# EAGLE design msx_usb2slot (EAGLE 7.6.0)

## Sheet 1 of 2
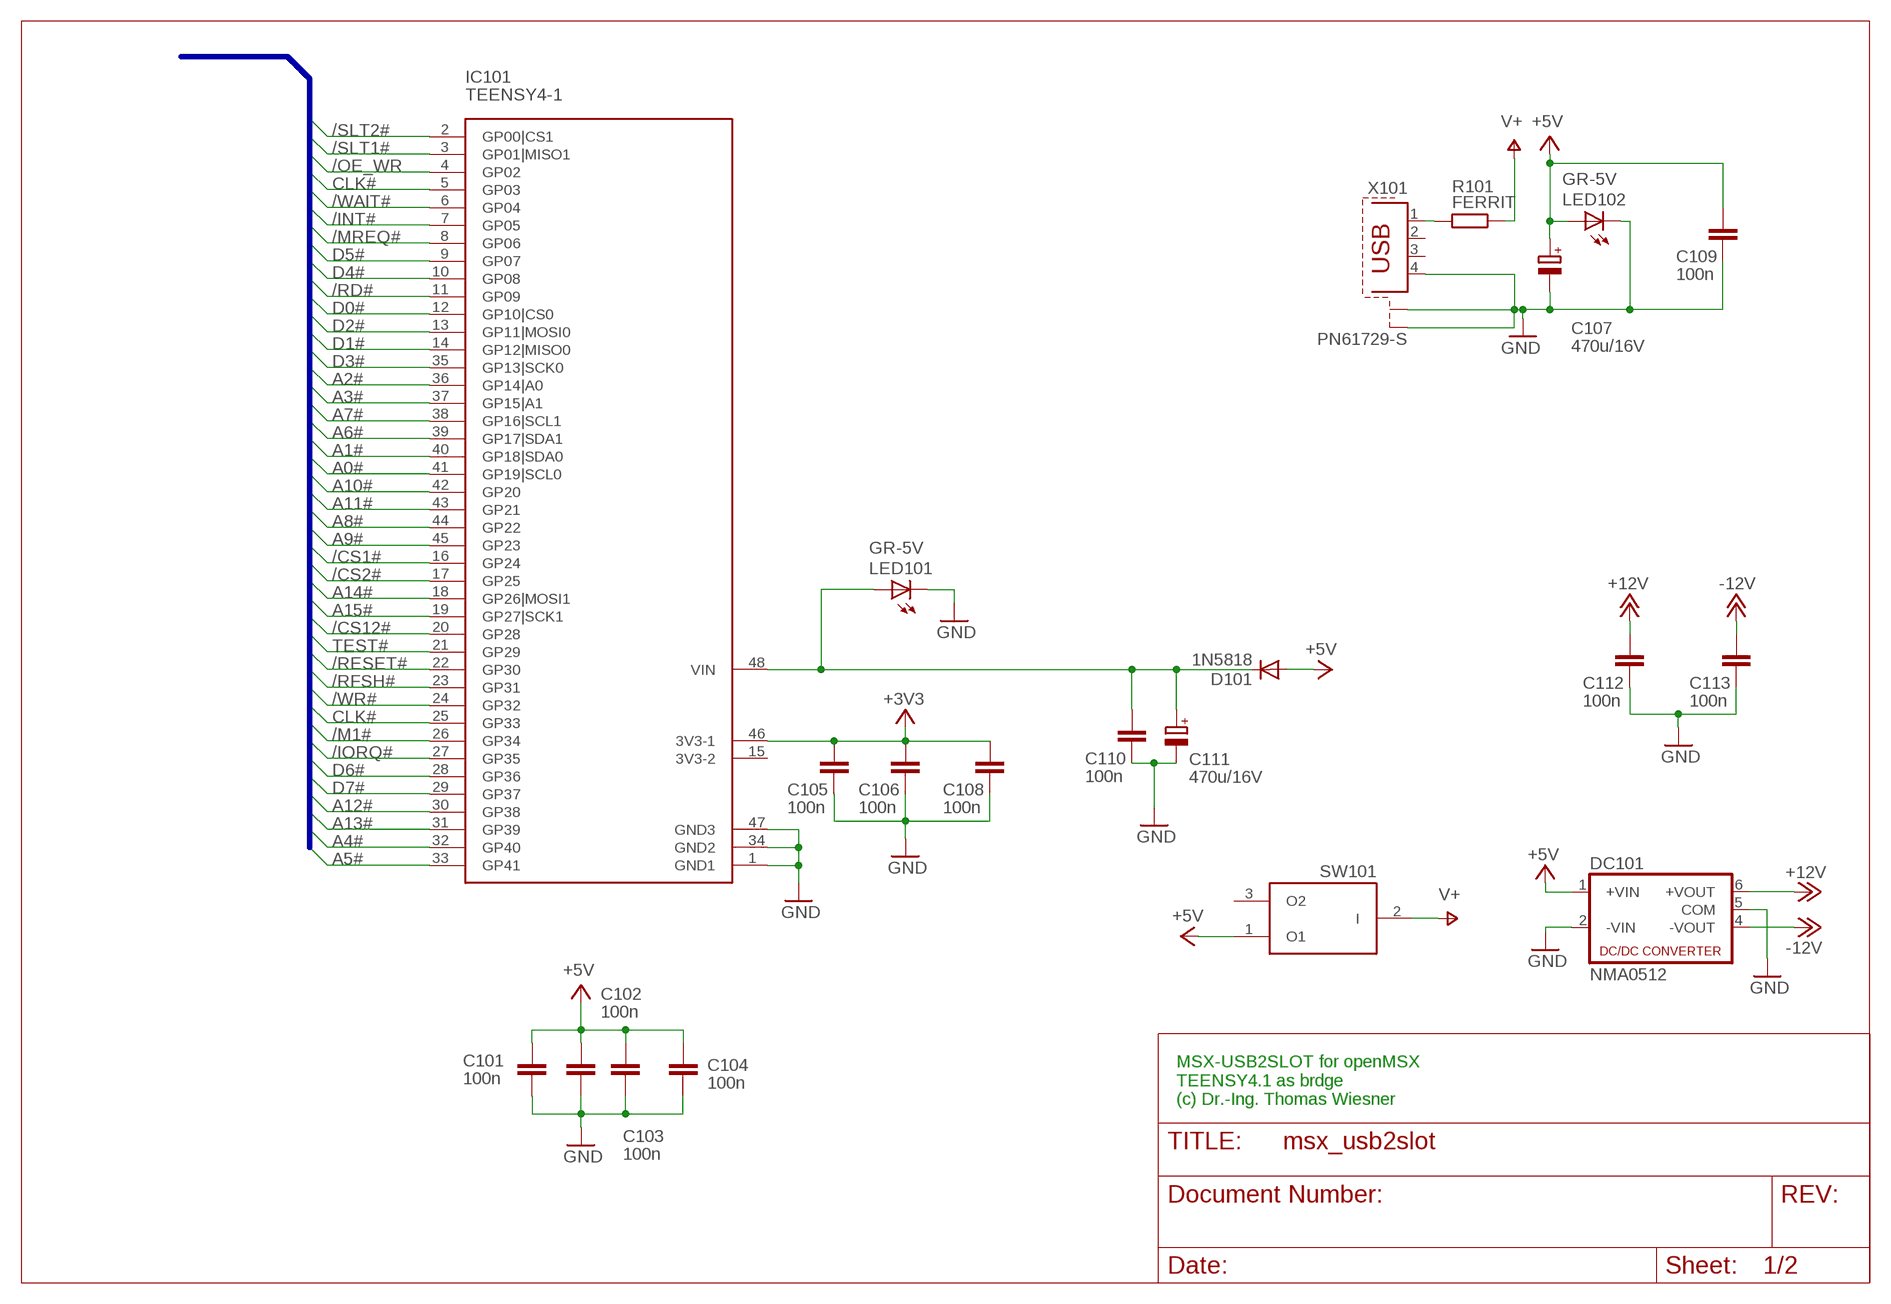
[diagram p0: schematic, sheet 1]

### Parts
C101  100n  C-EU025-025X050  [C025-025X050]
C102  100n  C-EU025-025X050  [C025-025X050]
C103  100n  C-EU025-025X050  [C025-025X050]
C104  100n  C-EU025-025X050  [C025-025X050]
C105  100n  C-EU025-025X050  [C025-025X050]
C106  100n  C-EU025-025X050  [C025-025X050]
C107  470u/16V  CPOL-EUE3.5-8  [E3,5-8]
C108  100n  C-EU025-025X050  [C025-025X050]
C109  100n  C-EU025-025X050  [C025-025X050]
C110  100n  C-EU025-025X050  [C025-025X050]
C111  470u/16V  CPOL-EUE3.5-8  [E3,5-8]
C112  100n  C-EU025-025X050  [C025-025X050]
C113  100n  C-EU025-025X050  [C025-025X050]
D101  1N5818  1N4004  [DO41-10]
DC101  NMA0512  NMA  [NMA]
IC101  TEENSY4-1  [TEENSY4-1]
LED101  GR-5V  LED3MM  [LED3MM]
LED102  GR-5V  LED3MM  [LED3MM]
R101  FERRIT  R-EU_0207/10  [0207/10]
SW101  TS-13PA  [TS-13-P]
X101  PN61729-S  [PN61729-S]

### Nets
+3V3: C105.2 C106.2 C108.2 IC101.46(3V3-1) ; also sheet 2
+5V: C101.2 C102.2 C103.2 C104.2 C107.+ C109.2 D101.A DC101.1(+VIN) LED102.A SW101.1(O1) ; also sheet 2
+12V: C112.2 DC101.6(+VOUT) ; also sheet 2
-12V: C113.2 DC101.4(-VOUT) ; also sheet 2
/CS1#: IC101.16(GP24) ; also sheet 2
/CS2#: IC101.17(GP25) ; also sheet 2
/CS12#: IC101.20(GP28) ; also sheet 2
/INT#: IC101.7(GP05) ; also sheet 2
/IORQ#: IC101.27(GP35) ; also sheet 2
/M1#: IC101.26(GP34) ; also sheet 2
/MREQ#: IC101.8(GP06) ; also sheet 2
/OE_WR: IC101.4(GP02) ; also sheet 2
/RD#: IC101.11(GP09) ; also sheet 2
/RESET#: IC101.22(GP30) ; also sheet 2
/RFSH#: IC101.23(GP31) ; also sheet 2
/SLT1#: IC101.3(GP01|MISO1) ; also sheet 2
/SLT2#: IC101.2(GP00|CS1) ; also sheet 2
/WAIT#: IC101.6(GP04) ; also sheet 2
/WR#: IC101.24(GP32) ; also sheet 2
A0#: IC101.41(GP19|SCL0) ; also sheet 2
A1#: IC101.40(GP18|SDA0) ; also sheet 2
A2#: IC101.36(GP14|A0) ; also sheet 2
A3#: IC101.37(GP15|A1) ; also sheet 2
A4#: IC101.32(GP40) ; also sheet 2
A5#: IC101.33(GP41) ; also sheet 2
A6#: IC101.39(GP17|SDA1) ; also sheet 2
A7#: IC101.38(GP16|SCL1) ; also sheet 2
A8#: IC101.44(GP22) ; also sheet 2
A9#: IC101.45(GP23) ; also sheet 2
A10#: IC101.42(GP20) ; also sheet 2
A11#: IC101.43(GP21) ; also sheet 2
A12#: IC101.30(GP38) ; also sheet 2
A13#: IC101.31(GP39) ; also sheet 2
A14#: IC101.18(GP26|MOSI1) ; also sheet 2
A15#: IC101.19(GP27|SCK1) ; also sheet 2
CLK#: IC101.5(GP03) IC101.25(GP33) ; also sheet 2
D0#: IC101.12(GP10|CS0) ; also sheet 2
D1#: IC101.14(GP12|MISO0) ; also sheet 2
D2#: IC101.13(GP11|MOSI0) ; also sheet 2
D3#: IC101.35(GP13|SCK0) ; also sheet 2
D4#: IC101.10(GP08) ; also sheet 2
D5#: IC101.9(GP07) ; also sheet 2
D6#: IC101.28(GP36) ; also sheet 2
D7#: IC101.29(GP37) ; also sheet 2
GND: C101.1 C102.1 C103.1 C104.1 C105.1 C106.1 C107.- C108.1 C109.1 C110.1 C111.- C112.1 C113.1 DC101.2(-VIN) DC101.5(COM) IC101.1(GND1) IC101.34(GND2) IC101.47(GND3) LED101.K(C) LED102.K(C) X101.4 X101.S1 X101.S2 ; also sheet 2
N$1: C110.2 C111.+ D101.C IC101.48(VIN) LED101.A
N$2: R101.2 X101.1
TEST#: IC101.21(GP29) ; also sheet 2
V+: R101.1 SW101.2(I)
Unconnected: IC101.15(3V3-2) SW101.3(O2) X101.2 X101.3

### Buses
B$1

### Notes on the sheet
- MSX-USB2SLOT for openMSX
  TEENSY4.1 as brdge
  (c) Dr.-Ing. Thomas Wiesner

## Sheet 2 of 2
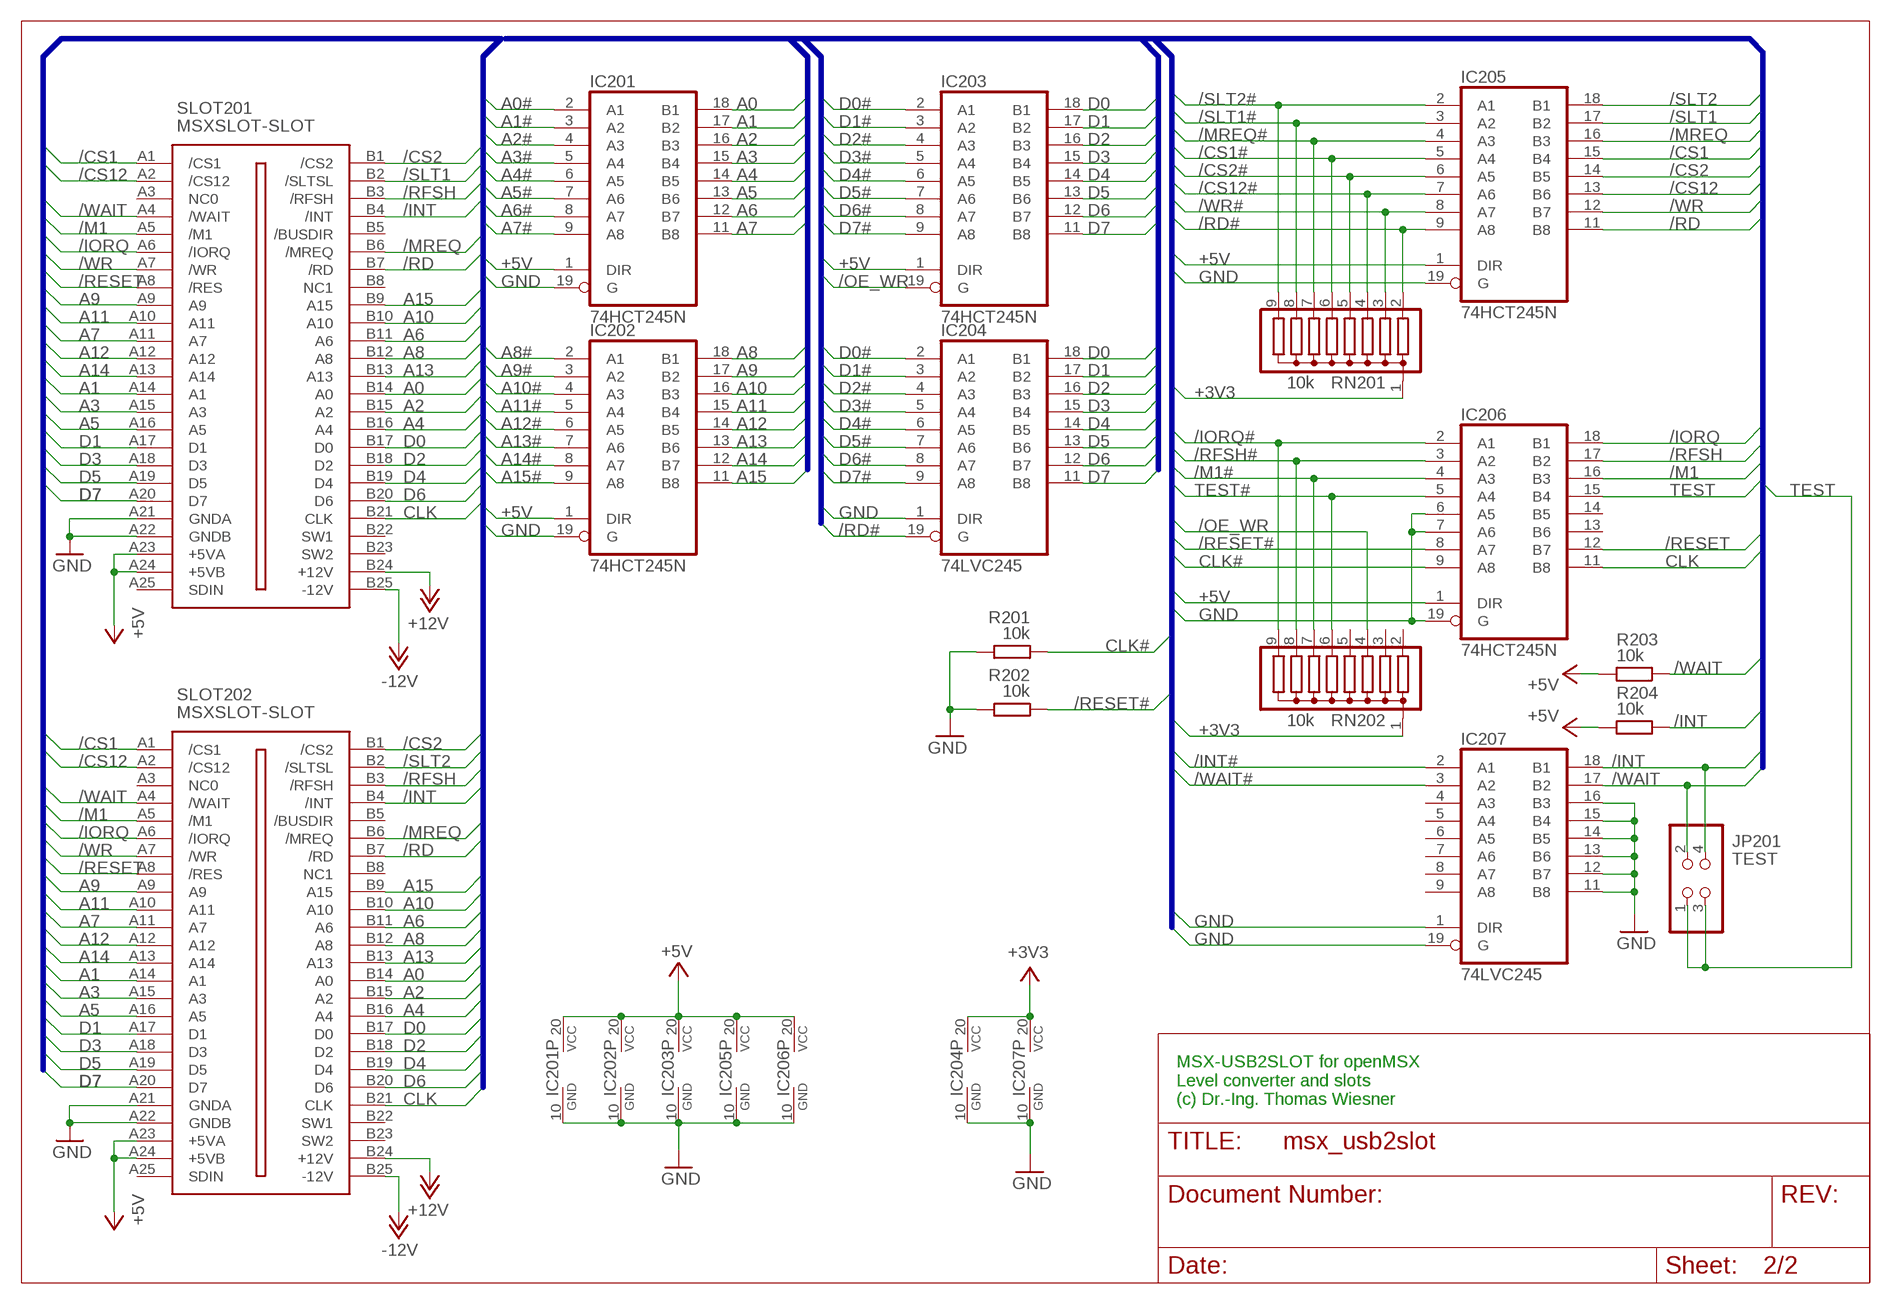
[diagram p1: schematic, sheet 2]

### Parts
IC201  74HCT245N  [DIL20]
IC202  74HCT245N  [DIL20]
IC203  74HCT245N  [DIL20]
IC204  74LVC245  74HCT245N  [DIL20]
IC205  74HCT245N  [DIL20]
IC206  74HCT245N  [DIL20]
IC207  74LVC245  74HCT245N  [DIL20]
JP201  TEST  PINHD-2X2  [2X02]
R201  10k  R-EU_0207/10  [0207/10]
R202  10k  R-EU_0207/10  [0207/10]
R203  10k  R-EU_0207/10  [0207/10]
R204  10k  R-EU_0207/10  [0207/10]
RN201  10k  G08R  [SIL9]
RN202  10k  G08R  [SIL9]
SLOT201  MSXSLOT-SLOT  [MSXSLOT]
SLOT202  MSXSLOT-SLOT  [MSXSLOT]

### Nets
+3V3: IC204.20(VCC) IC207.20(VCC) RN201.1 RN202.1 ; also sheet 1
+5V: IC201.1(DIR) IC201.20(VCC) IC202.1(DIR) IC202.20(VCC) IC203.1(DIR) IC203.20(VCC) IC205.1(DIR) IC205.20(VCC) IC206.1(DIR) IC206.20(VCC) R203.2 R204.2 SLOT201.A23(+5VA) SLOT201.A24(+5VB) SLOT202.A23(+5VA) SLOT202.A24(+5VB) ; also sheet 1
+12V: SLOT201.B24(+12V) SLOT202.B24(+12V) ; also sheet 1
-12V: SLOT201.B25(-12V) SLOT202.B25(-12V) ; also sheet 1
/CS1: IC205.15(B4) SLOT201.A1(/CS1) SLOT202.A1(/CS1)
/CS1#: IC205.5(A4) RN201.6 ; also sheet 1
/CS2: IC205.14(B5) SLOT201.B1(/CS2) SLOT202.B1(/CS2)
/CS2#: IC205.6(A5) RN201.5 ; also sheet 1
/CS12: IC205.13(B6) SLOT201.A2(/CS12) SLOT202.A2(/CS12)
/CS12#: IC205.7(A6) RN201.4 ; also sheet 1
/INT: IC207.18(B1) JP201.4 R204.1 SLOT201.B4(/INT) SLOT202.B4(/INT)
/INT#: IC207.2(A1) ; also sheet 1
/IORQ: IC206.18(B1) SLOT201.A6(/IORQ) SLOT202.A6(/IORQ)
/IORQ#: IC206.2(A1) RN202.9 ; also sheet 1
/M1: IC206.16(B3) SLOT201.A5(/M1) SLOT202.A5(/M1)
/M1#: IC206.4(A3) RN202.7 ; also sheet 1
/MREQ: IC205.16(B3) SLOT201.B6(/MREQ) SLOT202.B6(/MREQ)
/MREQ#: IC205.4(A3) RN201.7 ; also sheet 1
/OE_WR: IC203.19(G) RN202.4 ; also sheet 1
/RD: IC205.11(B8) SLOT201.B7(/RD) SLOT202.B7(/RD)
/RD#: IC204.19(G) IC205.9(A8) RN201.2 ; also sheet 1
/RESET: IC206.12(B7) SLOT201.A8(/RES) SLOT202.A8(/RES)
/RESET#: IC206.8(A7) R202.2 ; also sheet 1
/RFSH: IC206.17(B2) SLOT201.B3(/RFSH) SLOT202.B3(/RFSH)
/RFSH#: IC206.3(A2) RN202.8 ; also sheet 1
/SLT1: IC205.17(B2) SLOT201.B2(/SLTSL)
/SLT1#: IC205.3(A2) RN201.8 ; also sheet 1
/SLT2: IC205.18(B1) SLOT202.B2(/SLTSL)
/SLT2#: IC205.2(A1) RN201.9 ; also sheet 1
/WAIT: IC207.17(B2) JP201.2 R203.1 SLOT201.A4(/WAIT) SLOT202.A4(/WAIT)
/WAIT#: IC207.3(A2) ; also sheet 1
/WR: IC205.12(B7) SLOT201.A7(/WR) SLOT202.A7(/WR)
/WR#: IC205.8(A7) RN201.3 ; also sheet 1
A0: IC201.18(B1) SLOT201.B14(A0) SLOT202.B14(A0)
A0#: IC201.2(A1) ; also sheet 1
A1: IC201.17(B2) SLOT201.A14(A1) SLOT202.A14(A1)
A1#: IC201.3(A2) ; also sheet 1
A2: IC201.16(B3) SLOT201.B15(A2) SLOT202.B15(A2)
A2#: IC201.4(A3) ; also sheet 1
A3: IC201.15(B4) SLOT201.A15(A3) SLOT202.A15(A3)
A3#: IC201.5(A4) ; also sheet 1
A4: IC201.14(B5) SLOT201.B16(A4) SLOT202.B16(A4)
A4#: IC201.6(A5) ; also sheet 1
A5: IC201.13(B6) SLOT201.A16(A5) SLOT202.A16(A5)
A5#: IC201.7(A6) ; also sheet 1
A6: IC201.12(B7) SLOT201.B11(A6) SLOT202.B11(A6)
A6#: IC201.8(A7) ; also sheet 1
A7: IC201.11(B8) SLOT201.A11(A7) SLOT202.A11(A7)
A7#: IC201.9(A8) ; also sheet 1
A8: IC202.18(B1) SLOT201.B12(A8) SLOT202.B12(A8)
A8#: IC202.2(A1) ; also sheet 1
A9: IC202.17(B2) SLOT201.A9 SLOT202.A9
A9#: IC202.3(A2) ; also sheet 1
A10: IC202.16(B3) SLOT201.B10(A10) SLOT202.B10(A10)
A10#: IC202.4(A3) ; also sheet 1
A11: IC202.15(B4) SLOT201.A10(A11) SLOT202.A10(A11)
A11#: IC202.5(A4) ; also sheet 1
A12: IC202.14(B5) SLOT201.A12 SLOT202.A12
A12#: IC202.6(A5) ; also sheet 1
A13: IC202.13(B6) SLOT201.B13(A13) SLOT202.B13(A13)
A13#: IC202.7(A6) ; also sheet 1
A14: IC202.12(B7) SLOT201.A13(A14) SLOT202.A13(A14)
A14#: IC202.8(A7) ; also sheet 1
A15: IC202.11(B8) SLOT201.B9(A15) SLOT202.B9(A15)
A15#: IC202.9(A8) ; also sheet 1
CLK: IC206.11(B8) SLOT201.B21(CLK) SLOT202.B21(CLK)
CLK#: IC206.9(A8) R201.2 ; also sheet 1
D0: IC203.18(B1) IC204.18(B1) SLOT201.B17(D0) SLOT202.B17(D0)
D0#: IC203.2(A1) IC204.2(A1) ; also sheet 1
D1: IC203.17(B2) IC204.17(B2) SLOT201.A17(D1) SLOT202.A17(D1)
D1#: IC203.3(A2) IC204.3(A2) ; also sheet 1
D2: IC203.16(B3) IC204.16(B3) SLOT201.B18(D2) SLOT202.B18(D2)
D2#: IC203.4(A3) IC204.4(A3) ; also sheet 1
D3: IC203.15(B4) IC204.15(B4) SLOT201.A18(D3) SLOT202.A18(D3)
D3#: IC203.5(A4) IC204.5(A4) ; also sheet 1
D4: IC203.14(B5) IC204.14(B5) SLOT201.B19(D4) SLOT202.B19(D4)
D4#: IC203.6(A5) IC204.6(A5) ; also sheet 1
D5: IC203.13(B6) IC204.13(B6) SLOT201.A19(D5) SLOT202.A19(D5)
D5#: IC203.7(A6) IC204.7(A6) ; also sheet 1
D6: IC203.12(B7) IC204.12(B7) SLOT201.B20(D6) SLOT202.B20(D6)
D6#: IC203.8(A7) IC204.8(A7) ; also sheet 1
D7: IC203.11(B8) IC204.11(B8) SLOT201.A20(D7) SLOT202.A20(D7)
D7#: IC203.9(A8) IC204.9(A8) ; also sheet 1
GND: IC201.10(GND) IC201.19(G) IC202.10(GND) IC202.19(G) IC203.10(GND) IC204.1(DIR) IC204.10(GND) IC205.10(GND) IC205.19(G) IC206.6(A5) IC206.7(A6) IC206.10(GND) IC206.19(G) IC207.1(DIR) IC207.10(GND) IC207.11(B8) IC207.12(B7) IC207.13(B6) IC207.14(B5) IC207.15(B4) IC207.16(B3) IC207.19(G) R201.1 R202.1 SLOT201.A21(GNDA) SLOT201.A22(GNDB) SLOT202.A21(GNDA) SLOT202.A22(GNDB) ; also sheet 1
TEST: IC206.15(B4) JP201.1 JP201.3
TEST#: IC206.5(A4) RN202.6 ; also sheet 1
Unconnected: IC206.13(B6) IC206.14(B5) IC207.4(A3) IC207.5(A4) IC207.6(A5) IC207.7(A6) IC207.8(A7) IC207.9(A8) RN202.2 RN202.3 RN202.5 SLOT201.A3(NC0) SLOT201.A25(SDIN) SLOT201.B5(/BUSDIR) SLOT201.B8(NC1) SLOT201.B22(SW1) SLOT201.B23(SW2) SLOT202.A3(NC0) SLOT202.A25(SDIN) SLOT202.B5(/BUSDIR) SLOT202.B8(NC1) SLOT202.B22(SW1) SLOT202.B23(SW2)

### Buses
B$5
B$2

### Notes on the sheet
- MSX-USB2SLOT for openMSX
  Level converter and slots
  (c) Dr.-Ing. Thomas Wiesner

## Library data of the parts
C101-C106 C108-C110 C112 C113 = rcl:C-EU: CAPACITOR, European symbol
C107 C111 = rcl:CPOL-EU: POLARIZED CAPACITOR, European symbol
D101 = diode:1N4004: DIODE general purpose rectifier, 1 A
DC101 = dc-dc-converter:NMA: DC-DC CONVERTER; MF: C & D TECHNOLOGIES, INC; MPN: NMA0515SC; OC_FARNELL: 1021434; OC_NEWARK: 61K3064
IC101 = mbc:TEENSY4-1
IC201-IC207 = 74xx-eu:74*245: Octal BUS TRANSCEIVER, 3-state
JP201 = pinhead:PINHD-2X2: PIN HEADER
LED101 LED102 = led:LED: LED OSRAM: - CHIPLED LG R971, LG N971, LY N971, LG Q971, LY Q971, LO R971, LY R971 LH N974, LH R974 LS Q976, LO Q976, LY Q976 LO Q996 - Hyper CHIPLED LW Q18S LB Q993, LB Q99A, LB R99A - SideLED LS A670, LO A670, LY A670, LG A670, LP A670 LB A673, LV A673, LT A673, LW A673 LH A674 LY A675 LS A676, LA A676, LO A676, LY A676, LW A676 LS A679, LY A679, LG A679 - Hyper Micro SIDELED® LS Y876, LA Y876, LO Y876, LY Y876 LT Y87S - SmartLED LW L88C, LW L88S LB L89C, LB L89S, LG L890 LS L89K, LO L89K, LY L89K LS L896, LA L896, LO L896, LY L896 - TOPLED LS T670, LO T670, LY T670, LG T670, LP T670 LSG T670, LSP T670, LSY T670, LOP T670, LYG T670 LG T671, LOG T671, LSG T671 LB T673, LV T673, LT T673, LW T673 LH T674 LS T676, LA T676, LO T676, LY T676, LB T676, LH T676, LSB T676, LW T676 LB T67C, LV T67C, LT T67C, LS T67K, LO T67K, LY T67K, LW E67C LS E67B, LA E67B, LO E67B, LY E67B, LB E67C, LV E67C, LT E67C LW T67C LS T679, LY T679, LG T679 LS T770, LO T770, LY T770, LG T770, LP T770 LB T773, LV T773, LT T773, LW T773 LH T774 LS E675, LA E675, LY E675, LS T675 LS T776, LA T776, LO T776, LY T776, LB T776 LHGB T686 LT T68C, LB T68C - Hyper Mini TOPLED® LB M676 - Mini TOPLED Santana® LG M470 LS M47K, LO M47K, LY M47K Source: http://www.osram.convergy.de LUXEON: - LUMILED® LXK2-PW12-R00, LXK2-PW12-S00, LXK2-PW14-U00, LXK2-PW14-V00 LXK2-PM12-R00, LXK2-PM12-S00, LXK2-PM14-U00 LXK2-PE12-Q00, LXK2-PE12-R00, LXK2-PE12-S00, LXK2-PE14-T00, LXK2-PE14-U00 LXK2-PB12-K00, LXK2-PB12-L00, LXK2-PB12-M00, LXK2-PB14-N00, LXK2-PB14-P00, LXK2-PB14-Q00 LXK2-PR12-L00, LXK2-PR12-M00, LXK2-PR14-Q00, LXK2-PR14-R00 LXK2-PD12-Q00, LXK2-PD12-R00, LXK2-PD12-S00 LXK2-PH12-R00, LXK2-PH12-S00 LXK2-PL12-P00, LXK2-PL12-Q00, LXK2-PL12-R00 Source: www.luxeon.com KINGBRIGHT: KA-3528ASYC Source: www.kingbright.com
R101 R201-R204 = resistor:R-EU_: RESISTOR, European symbol
RN201 RN202 = resistor-sil:G08R: SIL RESISTOR; OC_FARNELL: unknown; OC_NEWARK: unknown
SLOT201 SLOT202 = mbc:MSXSLOT: MSX-Slot-Verbinder
SW101 = mbc:TS-13P: TS-13P - Umschalter liegend Printmontage
X101 = con-berg:PN61729-S: BERG USB connector; OC_FARNELL: unknown; OC_NEWARK: unknown

## Board
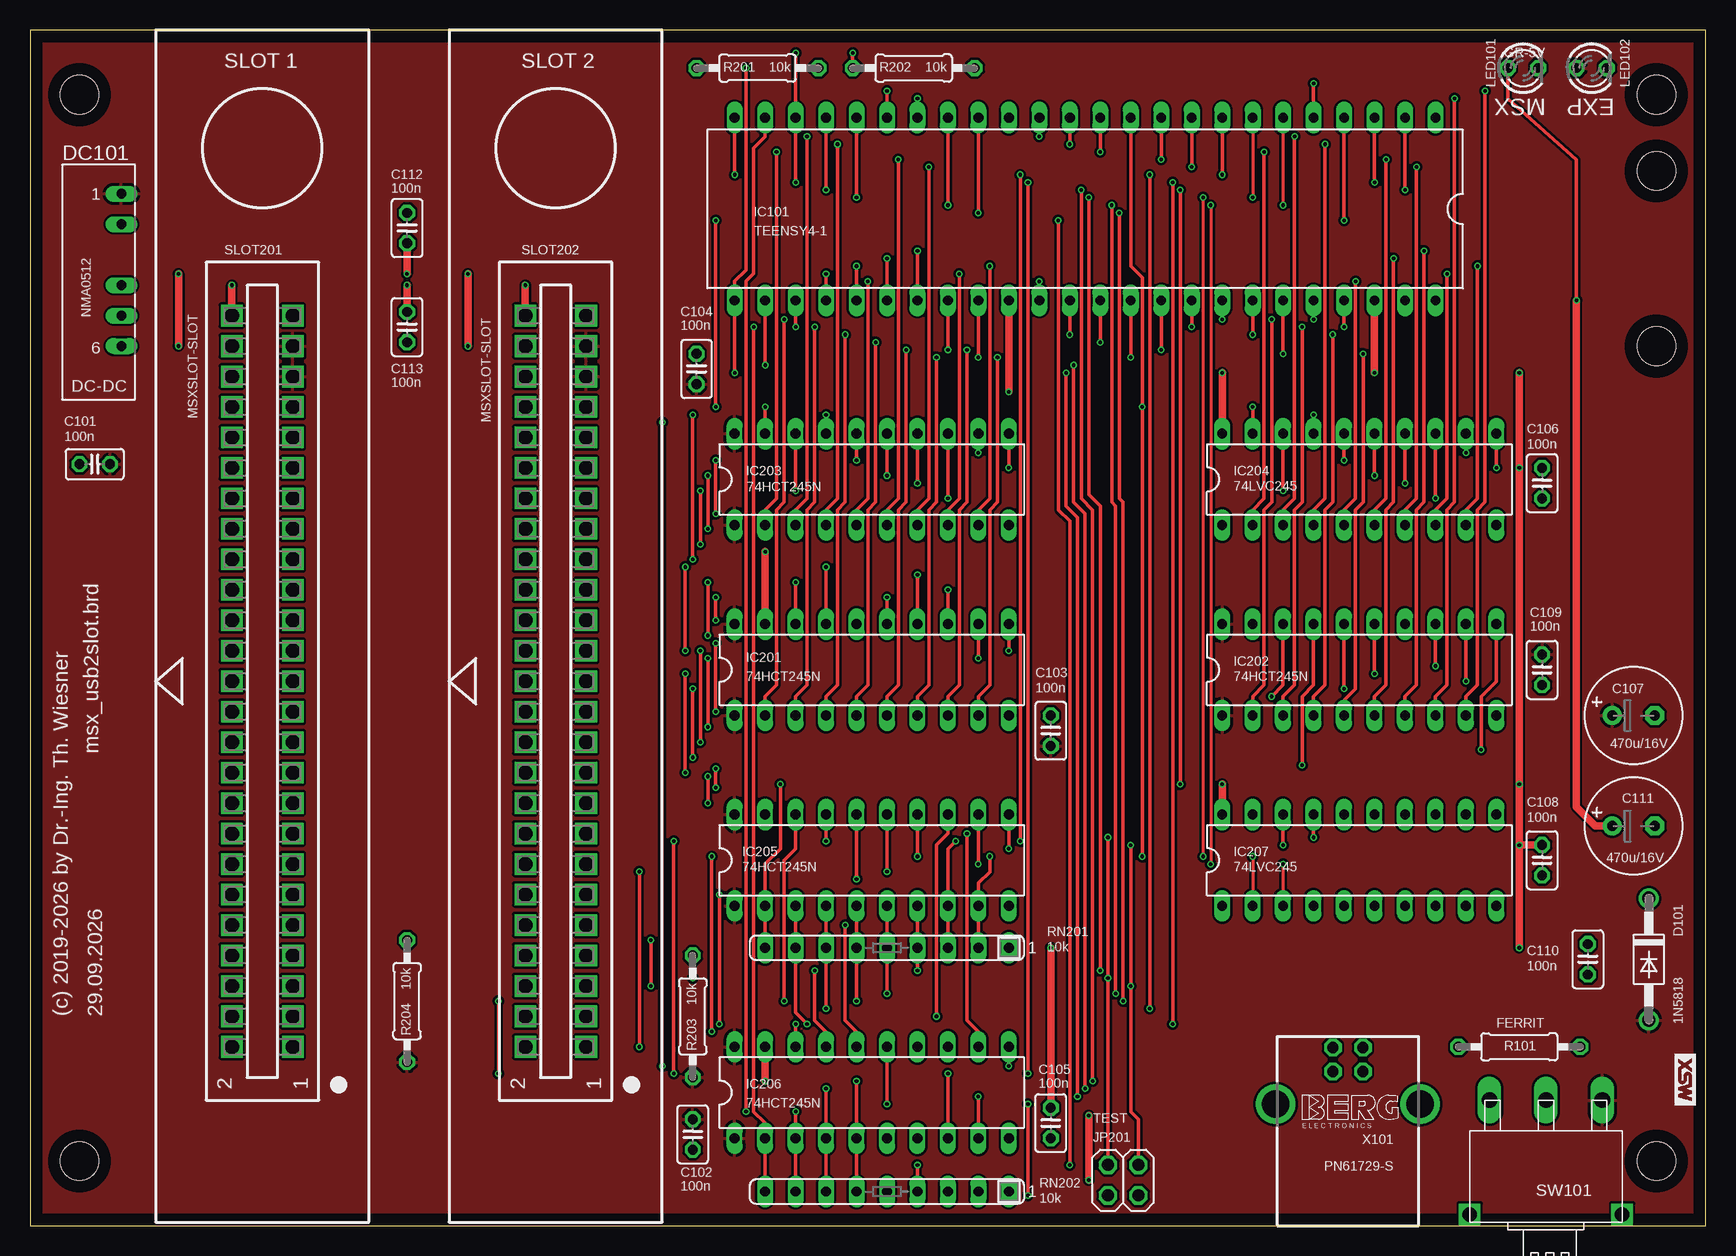
[diagram p2: board, top side]
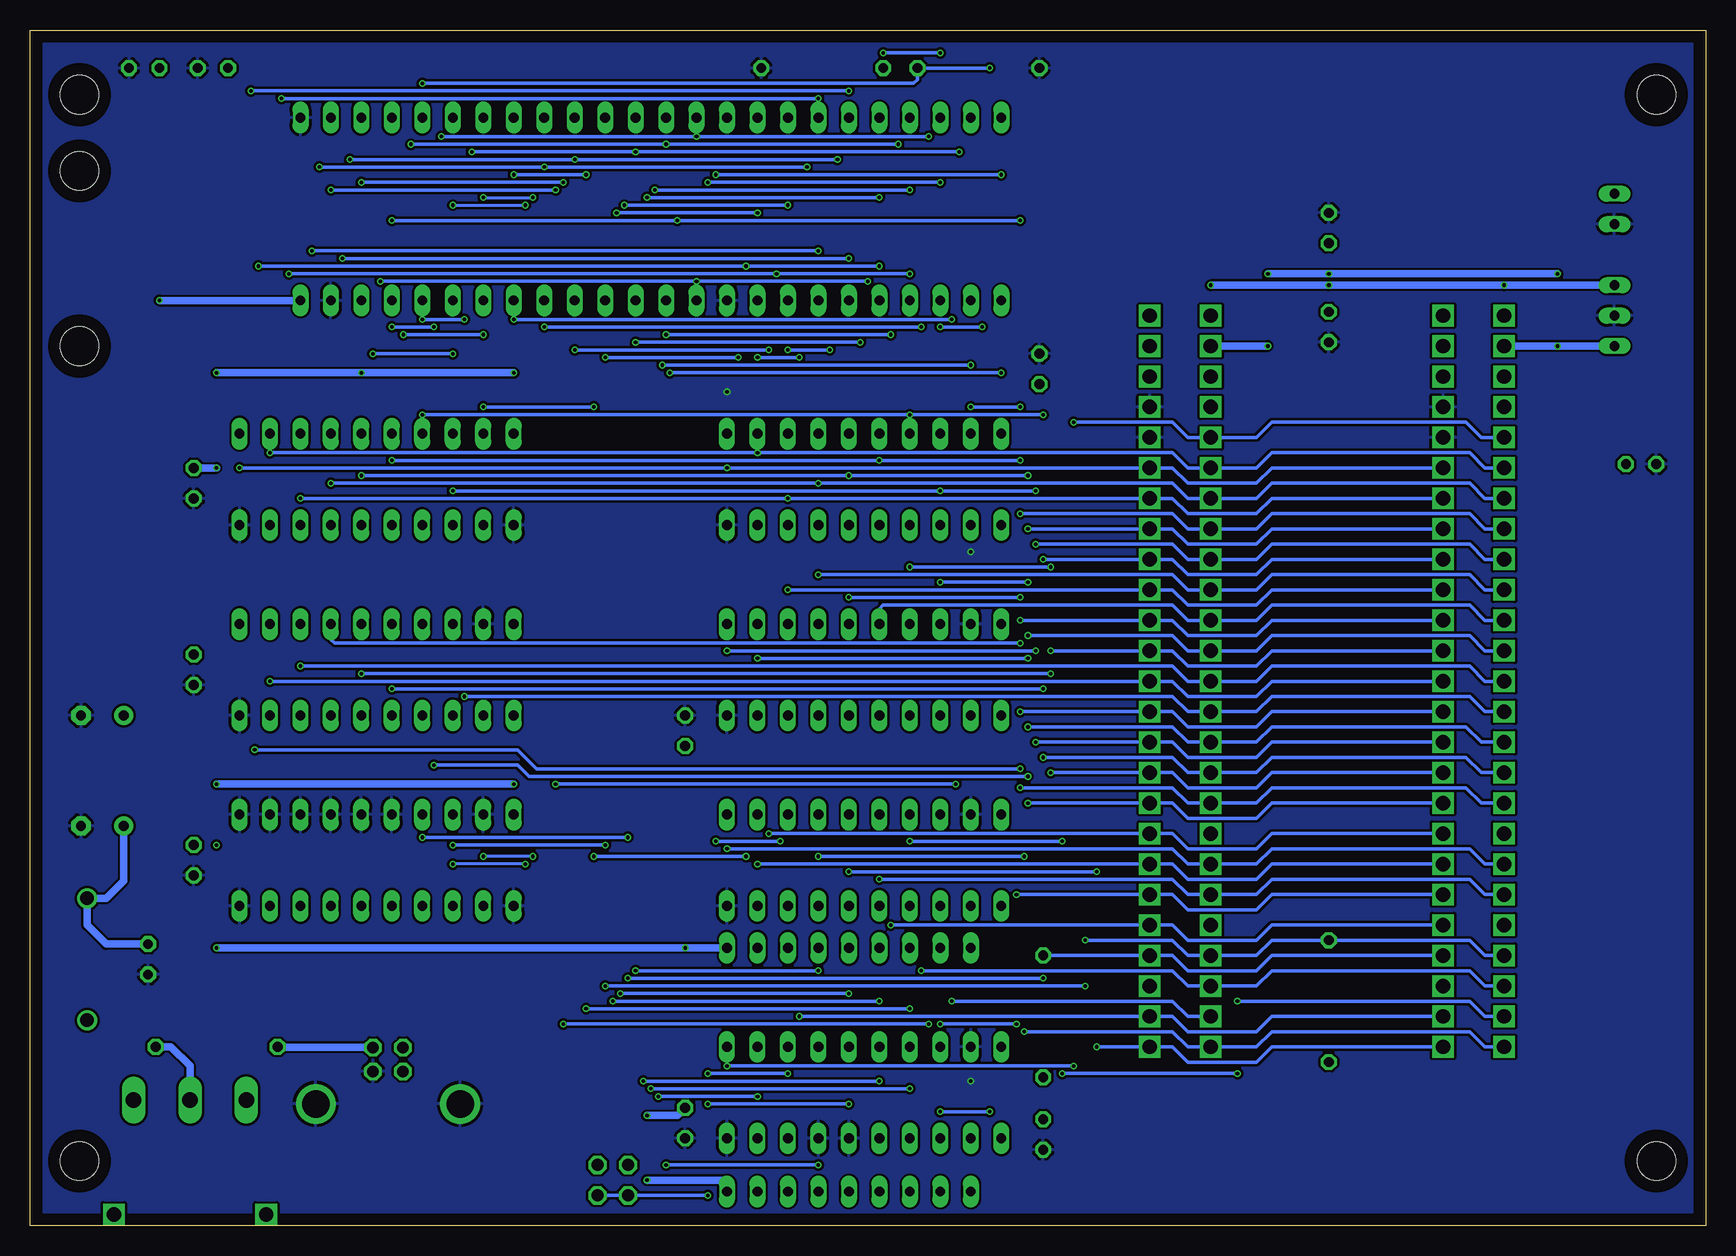
[diagram p3: board, bottom side, seen from below]

Size 139.7 x 99.69 mm. Coordinates in mm from the lower left corner, seen from the top.
Outline: 0,0 139.7,0 139.7,99.69 0,99.69 0,0
Copper layers (1*16): Top 0.035mm / dielectric 1.5mm / Bottom 0.035mm
Design rules "default *": minimum track width 10mil, minimum drill 0.3mm, track to track 8mil, track to pad 4mil, pad to pad 8mil, via to via 8mil, smd to smd 8mil, copper to edge 40mil, drill to drill 8mil, minimum pad ring 10mil, minimum via ring 0.125mm, stop-mask expansion 4mil, vias tented up to drill 0mil, thermal gap 10mil
Holes 3.2 mm at 135.57,5.4 135.57,94.3 4.13,94.3 4.13,5.4 135.57,87.95 135.57,73.34

### Footprints (pad centres in the part's own frame; a part is rotated, then mirrored left to right if it is on the bottom)
C025-025X050 = drill 0.813 octagon: 1 -1.27,0; 2 1.27,0
E3,5-8 = drill 0.813 pad 1.6: + -1.778,0 | drill 0.813 pad 1.6 octagon: - 1.778,0
DO41-10 = drill 1.118: A 5.08,0; C -5.08,0
NMA = drill 0.813 long: 1 0,6.35; 2 0,3.81; 4 0,-1.27; 5 0,-3.81; 6 0,-6.35
TEENSY4-1 = drill 0.813 long: 1 -29.21,-7.62; 2 -26.67,-7.62; 3 -24.13,-7.62; 4 -21.59,-7.62; 5 -19.05,-7.62; 6 -16.51,-7.62; 7 -13.97,-7.62; 8 -11.43,-7.62; 9 -8.89,-7.62; 10 -6.35,-7.62; 11 -3.81,-7.62; 12 -1.27,-7.62; 13 1.27,-7.62; 14 3.81,-7.62; 15 6.35,-7.62; 16 8.89,-7.62; 17 11.43,-7.62; 18 13.97,-7.62; 19 16.51,-7.62; 20 19.05,-7.62; 21 21.59,-7.62; 22 24.13,-7.62; 23 26.67,-7.62; 24 29.21,-7.62; 25 29.21,7.62; 26 26.67,7.62; 27 24.13,7.62; 28 21.59,7.62; 29 19.05,7.62; 30 16.51,7.62; 31 13.97,7.62; 32 11.43,7.62; 33 8.89,7.62; 34 6.35,7.62; 35 3.81,7.62; 36 1.27,7.62; 37 -1.27,7.62; 38 -3.81,7.62; 39 -6.35,7.62; 40 -8.89,7.62; 41 -11.43,7.62; 42 -13.97,7.62; 43 -16.51,7.62; 44 -19.05,7.62; 45 -21.59,7.62; 46 -24.13,7.62; 47 -26.67,7.62; 48 -29.21,7.62
DIL20 = drill 0.813 long: 1 -11.43,-3.81; 2 -8.89,-3.81; 3 -6.35,-3.81; 4 -3.81,-3.81; 5 -1.27,-3.81; 6 1.27,-3.81; 7 3.81,-3.81; 8 6.35,-3.81; 9 8.89,-3.81; 10 11.43,-3.81; 11 11.43,3.81; 12 8.89,3.81; 13 6.35,3.81; 14 3.81,3.81; 15 1.27,3.81; 16 -1.27,3.81; 17 -3.81,3.81; 18 -6.35,3.81; 19 -8.89,3.81; 20 -11.43,3.81
2X02 = drill 1.016 octagon: 1 -1.27,-1.27; 2 -1.27,1.27; 3 1.27,-1.27; 4 1.27,1.27
LED3MM = drill 0.813 octagon: A -1.27,0; K 1.27,0
0207/10 = drill 0.813 octagon: 1 -5.08,0; 2 5.08,0
SIL9 = drill 0.813 long: 1 -10.16,0; 2 -7.62,0; 3 -5.08,0; 4 -2.54,0; 5 0,0; 6 2.54,0; 7 5.08,0; 8 7.62,0; 9 10.16,0
MSXSLOT = drill 1.2 pad 1.778 square: A1 30.48,2.54; A2 27.94,2.54; A3 25.4,2.54; A4 22.86,2.54; A5 20.32,2.54; A6 17.78,2.54; A7 15.24,2.54; A8 12.7,2.54; A9 10.16,2.54; A10 7.62,2.54; A11 5.08,2.54; A12 2.54,2.54; A13 0,2.54; A14 -2.54,2.54; A15 -5.08,2.54; A16 -7.62,2.54; A17 -10.16,2.54; A18 -12.7,2.54; A19 -15.24,2.54; A20 -17.78,2.54; A21 -20.32,2.54; A22 -22.86,2.54; A23 -25.4,2.54; A24 -27.94,2.54; A25 -30.48,2.54; B1 30.48,-2.54; B2 27.94,-2.54; B3 25.4,-2.54; B4 22.86,-2.54; B5 20.32,-2.54; B6 17.78,-2.54; B7 15.24,-2.54; B8 12.7,-2.54; B9 10.16,-2.54; B10 7.62,-2.54; B11 5.08,-2.54; B12 2.54,-2.54; B13 0,-2.54; B14 -2.54,-2.54; B15 -5.08,-2.54; B16 -7.62,-2.54; B17 -10.16,-2.54; B18 -12.7,-2.54; B19 -15.24,-2.54; B20 -17.78,-2.54; B21 -20.32,-2.54; B22 -22.86,-2.54; B23 -25.4,-2.54; B24 -27.94,-2.54; B25 -30.48,-2.54
TS-13-P = drill 1.3 long: 1 0,-4.7; 2 0,0; 3 0,4.7 | drill 1.2 square: P$1 -9.525,-6.35; P$2 -9.525,6.35
PN61729-S = drill 0.95 octagon: 1 1.25,4.71; 2 -1.25,4.71; 3 -1.25,2.71; 4 1.25,2.71 | drill 2.3 pad 2.9: S1 -6.02,0; S2 6.02,0

### Placement (x,y rotation side)
C101  5.4,63.5 0 top
C102  55.24,7.62 90 top
C103  85.09,41.27 270 top
C104  55.56,71.44 270 top
C105  85.09,8.57 90 top
C106  126.05,61.91 90 top
C107  133.67,42.55 0 top
C108  126.05,30.48 90 top
C109  126.05,46.35 90 top
C110  129.86,22.23 90 top
C111  133.67,33.34 0 top
C112  31.43,83.19 270 top
C113  31.43,74.93 90 top
D101  134.94,22.23 270 top
DC101  7.62,79.69 0 top
IC101  87.95,84.77 180 top
IC201  70.17,46.35 0 top
IC202  110.81,46.35 0 top
IC203  70.17,62.23 0 top
IC204  110.81,62.23 0 top
IC205  70.17,30.48 0 top
IC206  70.17,11.11 0 top
IC207  110.81,30.48 0 top
JP201  91.12,3.81 0 top
LED101  124.46,96.52 0 top
LED102  130.18,96.52 0 top
R101  124.14,14.92 180 top
R201  60.64,96.52 0 top
R202  73.66,96.52 180 top
R203  55.24,17.46 270 top
R204  31.43,18.73 270 top
RN201  71.44,23.18 180 top
RN202  71.44,2.86 180 top
SLOT201  19.37,45.4 270 top
SLOT202  43.81,45.4 270 top
SW101  126.36,10.48 90 top
X101  109.86,10.16 0 top

### Tracks (layer width: path | path; a pad name or v marks a point on that pad's centre or on a via)
+3V3  (via drill 0.3)
  Top 0.61: v85.09,23.18 C105.2 | v88.27,3.81 v88.27,9.21 | v124.14,23.18 v124.14,31.75 | v124.14,31.75 v124.14,36.83 v124.14,63.18 v124.14,71.12 | v99.38,36.83 IC207.20 | v99.38,71.12 IC204.20 | IC101.46 v112.08,71.12 | C108.2 v124.14,31.75
  Bottom 0.61: RN201.1 v85.09,23.18 v124.14,23.18 | RN202.1 81.6,3.49 81.92,3.81 v88.27,3.81 | v88.27,9.21 85.72,9.21 C105.2 | v124.14,36.83 v99.38,36.83 | v124.14,71.12 v112.08,71.12 v99.38,71.12 | C106.2 v124.14,63.18
+5V
  pour Top: 0,99.69 139.7,99.69 139.7,0 0,0
+12V  (via drill 0.3)
  Top 0.61: v36.51,73.34 v36.51,79.38 | v12.38,79.38 v12.38,73.34 | C112.2 v31.43,79.38
  Bottom 0.61: DC101.6 v12.38,73.34 SLOT201.B24 | SLOT202.B24 v36.51,73.34 | v36.51,79.38 v31.43,79.38 v12.38,79.38
-12V  (via drill 0.3)
  Top 0.61: v41.27,78.42 SLOT202.B25 | SLOT201.B25 v16.83,78.42 | C113.2 v31.43,78.42
  Bottom 0.61: DC101.4 v16.83,78.42 v31.43,78.42 v41.27,78.42
/CS1  (via drill 0.3)
  Top 0.305: v50.8,14.92 v50.8,29.53 | v71.44,29.53 IC205.15
  Bottom 0.305: SLOT201.A1 36.2,14.92 37.47,13.65 43.18,13.65 44.45,14.92 SLOT202.A1 v50.8,14.92 | v50.8,29.53 v71.44,29.53
/CS1#  (via drill 0.3)
  Top 0.305: IC205.5 RN201.6 v68.9,18.73 | IC101.16 v79.06,84.45 | v90.81,84.45 90.81,60.64 91.12,60.33 v91.12,18.73
  Bottom 0.305: v79.06,84.45 v90.81,84.45 | v91.12,18.73 v68.9,18.73
/CS2  (via drill 0.3)
  Top 0.305: v56.83,16.19 v56.83,30.8 | v73.98,30.8 IC205.14
  Bottom 0.305: SLOT201.B1 18.41,14.92 19.68,16.19 36.2,16.19 37.47,14.92 SLOT202.B1 43.18,14.92 44.45,16.19 v56.83,16.19 | v56.83,30.8 v73.98,30.8
/CS2#  (via drill 0.3)
  Top 0.305: IC205.6 RN201.5 v71.44,19.37 | IC101.17 v76.52,85.09 | v90.17,85.09 90.17,60.33 90.49,60.01 v90.49,19.37
  Bottom 0.305: v76.52,85.09 v90.17,85.09 | v90.49,19.37 v71.44,19.37
/CS12  (via drill 0.3)
  Top 0.305: v75.56,17.46 75.56,31.75 76.52,32.7 IC205.13
  Bottom 0.305: SLOT201.A2 36.2,17.46 37.47,16.19 43.18,16.19 44.45,17.46 SLOT202.A2 v75.56,17.46
/CS12#  (via drill 0.3)
  Top 0.305: RN201.4 IC205.7 v73.98,21.27 | IC101.20 v68.9,85.72 | v88.27,85.72 88.27,60.96 89.22,60.01 v89.22,21.27
  Bottom 0.305: v68.9,85.72 v88.27,85.72 | v89.22,21.27 v73.98,21.27
/INT  (via drill 0.3)
  Top 0.305: v91.76,31.75 v91.76,20 91.76,9.53 92.39,8.89 JP201.4 | v104.46,31.75 IC207.18 | v51.75,20 v51.75,23.81
  Bottom 0.305: SLOT201.B4 18.41,22.54 19.68,23.81 R204.1 36.2,23.81 37.47,22.54 SLOT202.B4 43.18,22.54 44.45,23.81 v51.75,23.81 | v91.76,31.75 v104.46,31.75 | v91.76,20 v51.75,20
/INT#  (via drill 0.3)
  Top 0.254: IC101.7 v101.92,85.72 | v97.79,85.72 v97.79,30.8 | v101.92,30.8 IC207.2
  Bottom 0.254: v101.92,85.72 v97.79,85.72 | v97.79,30.8 v101.92,30.8
/IORQ  (via drill 0.3)
  Top 0.305: v57.47,27.62 v57.47,16.83 | v63.82,16.83 IC206.18
  Bottom 0.305: SLOT201.A6 36.2,27.62 37.47,26.35 43.18,26.35 44.45,27.62 SLOT202.A6 v57.47,27.62 | v57.47,16.83 v63.82,16.83
/IORQ#  (via drill 0.3)
  Top 0.305: RN202.9 IC206.2 61.28,8.57 60.33,9.53 v60.33,74.93 | v63.82,74.93 IC101.27
  Bottom 0.305: v60.33,74.93 v63.82,74.93
/M1  (via drill 0.3)
  Top 0.305: v67.94,25.08 67.94,17.14 68.9,16.19 IC206.16
  Bottom 0.305: SLOT201.A5 36.2,25.08 37.47,23.81 43.18,23.81 44.45,25.08 SLOT202.A5 v67.94,25.08
/M1#  (via drill 0.3)
  Top 0.305: RN202.7 IC206.4 v66.36,11.43 | IC101.26 v61.28,71.75 | v87,71.75 87,60.33 87.95,59.37 v87.95,11.43
  Bottom 0.305: v61.28,71.75 v87,71.75 | v87.95,11.43 v66.36,11.43
/MREQ  (via drill 0.3)
  Top 0.305: v68.9,28.89 IC205.16
  Bottom 0.305: SLOT201.B6 18.41,27.62 19.68,28.89 36.2,28.89 37.47,27.62 SLOT202.B6 43.18,27.62 44.45,28.89 v68.9,28.89
/MREQ#  (via drill 0.3)
  Top 0.305: IC205.4 RN201.7 v66.36,18.1 | IC101.8 v99.38,87.63 | v93.34,87.63 v93.34,18.1
  Bottom 0.305: v99.38,87.63 v93.34,87.63 | v93.34,18.1 v66.36,18.1
/OE_WR  (via drill 0.3)
  Top 0.305: IC101.4 v109.54,83.82 | v57.15,83.82 v57.15,68.26 | v61.28,68.26 IC203.19 | RN202.4 v73.98,5.08 | v86.68,5.08 86.68,58.74 85.72,59.69 v85.72,83.82
  Bottom 0.305: v109.54,83.82 v85.72,83.82 v57.15,83.82 | v57.15,68.26 v61.28,68.26 | v73.98,5.08 v86.68,5.08
/RD  (via drill 0.3)
  Top 0.305: v81.6,31.43 IC205.11
  Bottom 0.305: SLOT201.B7 18.41,30.16 19.68,31.43 36.2,31.43 37.47,30.16 SLOT202.B7 43.18,30.16 44.45,31.43 v81.6,31.43
/RD#  (via drill 0.3)
  Top 0.305: RN201.2 IC205.9 79.06,28.57 80.01,29.53 v80.01,30.8 | IC101.11 91.76,80.01 92.71,79.06 v92.71,68.26 v92.71,30.8 | IC204.19 v101.92,68.26
  Bottom 0.305: v92.71,30.8 v80.01,30.8 | v101.92,68.26 v92.71,68.26
/RESET  (via drill 0.3)
  Top 0.305: v78.11,32.7 78.11,17.14 79.06,16.19 IC206.12
  Bottom 0.305: SLOT201.A8 36.2,32.7 37.47,31.43 43.18,31.43 44.45,32.7 SLOT202.A8 v78.11,32.7
/RESET#  (via drill 0.3)
  Top 0.305: v63.82,97.79 IC101.22 v63.82,87 | v68.58,97.79 R202.2 | v83.19,87 v83.19,12.7 | v76.52,12.7 IC206.8
  Bottom 0.305: v63.82,97.79 v68.58,97.79 | v63.82,87 v83.19,87 | v83.19,12.7 v76.52,12.7
/RFSH  (via drill 0.3)
  Top 0.305: v65.41,21.27 65.41,17.14 66.36,16.19 IC206.17
  Bottom 0.305: SLOT201.B3 18.41,20 19.68,21.27 36.2,21.27 37.47,20 SLOT202.B3 43.18,20 44.45,21.27 v65.41,21.27
/RFSH#  (via drill 0.3)
  Top 0.305: RN202.8 IC206.3 v63.82,9.53 | v59.69,9.53 59.69,78.74 60.33,79.38 60.33,89.85 61.28,90.81 IC101.23
  Bottom 0.305: v63.82,9.53 v59.69,9.53
/SLT1  (via drill 0.3)
  Top 0.305: v39.05,18.73 v39.05,12.7 | v53.66,12.7 v53.66,32.07 | v66.36,32.07 IC205.17
  Bottom 0.305: SLOT201.B2 18.41,17.46 19.68,18.73 v39.05,18.73 | v39.05,12.7 v53.66,12.7 | v53.66,32.07 v66.36,32.07
/SLT1#  (via drill 0.3)
  Top 0.305: IC205.3 RN201.8 63.82,17.78 v64.77,16.83 | IC101.3 v112.08,87 | v95.25,87 v95.25,16.83
  Bottom 0.305: v112.08,87 v95.25,87 | v95.25,16.83 v64.77,16.83
/SLT2  (via drill 0.3)
  Top 0.305: v62.87,18.73 62.87,30.48 63.82,31.43 IC205.18
  Bottom 0.305: SLOT202.B2 43.18,17.46 44.45,18.73 v62.87,18.73
/SLT2#  (via drill 0.3)
  Top 0.305: RN201.9 IC205.2 61.28,30.16 62.55,31.43 v62.55,36.83 | IC101.2 v114.62,86.36 | v95.89,86.36 v95.89,36.83
  Bottom 0.305: v114.62,86.36 v95.89,86.36 | v95.89,36.83 v62.55,36.83
/WAIT  (via drill 0.3)
  Top 0.305: v89.85,32.38 v89.85,20.64 JP201.2 | v107,32.38 IC207.17 | v55.24,20.64 R203.1
  Bottom 0.305: SLOT201.A4 36.2,22.54 37.47,21.27 43.18,21.27 44.45,22.54 SLOT202.A4 R203.1 | v89.85,32.38 v107,32.38 | v89.85,20.64 v55.24,20.64
/WAIT#  (via drill 0.3)
  Top 0.254: IC101.6 v104.46,85.09 | v98.42,85.09 v98.42,30.16 | v104.46,30.16 IC207.3
  Bottom 0.254: v104.46,85.09 v98.42,85.09 | v98.42,30.16 v104.46,30.16
/WR  (via drill 0.3)
  Top 0.305: v79.06,30.16 IC205.12
  Bottom 0.305: SLOT201.A7 36.2,30.16 37.47,28.89 43.18,28.89 44.45,30.16 SLOT202.A7 v79.06,30.16
/WR#  (via drill 0.3)
  Top 0.305: RN201.3 IC205.8 76.52,31.43 v77.15,32.07 | IC101.24 v58.74,87.63 | v82.55,87.63 v82.55,32.07
  Bottom 0.305: v58.74,87.63 v82.55,87.63 | v82.55,32.07 v77.15,32.07
A0  (via drill 0.3)
  Top 0.305: v56.52,49.21 v56.52,53.66 | v63.82,53.66 IC201.18
  Bottom 0.305: SLOT201.B14 18.41,47.94 19.68,49.21 36.2,49.21 37.47,47.94 SLOT202.B14 43.18,47.94 44.45,49.21 v56.52,49.21 | v56.52,53.66 v63.82,53.66
A0#  (via drill 0.3)
  Top 0.305: IC201.2 61.28,44.13 62.23,45.09 62.23,59.69 62.87,60.33 v62.87,75.56 | v99.38,75.56 IC101.41
  Bottom 0.305: v62.87,75.56 v99.38,75.56
A1  (via drill 0.3)
  Top 0.305: v54.61,47.94 v54.61,54.93 | v66.36,54.93 IC201.17
  Bottom 0.305: SLOT201.A14 36.2,47.94 37.47,46.67 43.18,46.67 44.45,47.94 SLOT202.A14 v54.61,47.94 | v54.61,54.93 v66.36,54.93
A1#  (via drill 0.3)
  Top 0.305: IC201.3 63.82,44.13 64.77,45.09 64.77,59.69 65.41,60.33 v65.41,74.93 | v96.84,74.93 IC101.40
  Bottom 0.305: v65.41,74.93 v96.84,74.93
A2
  Bottom 0.305: SLOT201.B15 18.41,50.48 19.68,51.75 36.2,51.75 37.47,50.48 SLOT202.B15 43.18,50.48 44.45,51.75 68.58,51.75 68.9,51.44 IC201.16
A2#  (via drill 0.3)
  Top 0.305: IC201.4 66.36,44.13 67.31,45.09 67.31,59.69 67.94,60.33 v67.94,74.3 | v86.68,74.3 IC101.36
  Bottom 0.305: v67.94,74.3 v86.68,74.3
A3  (via drill 0.3)
  Top 0.305: v57.15,50.48 v57.15,52.39 | v71.44,52.39 IC201.15
  Bottom 0.305: SLOT201.A15 36.2,50.48 37.47,49.21 43.18,49.21 44.45,50.48 SLOT202.A15 v57.15,50.48 | v57.15,52.39 v71.44,52.39
A3#  (via drill 0.3)
  Top 0.305: IC201.5 68.9,44.13 69.85,45.09 69.85,59.69 70.48,60.33 v70.48,73.66 | v89.22,73.66 IC101.37
  Bottom 0.305: v70.48,73.66 v89.22,73.66
A4  (via drill 0.3)
  Top 0.305: v73.98,54.29 IC201.14
  Bottom 0.305: SLOT201.B16 18.41,53.02 19.68,54.29 36.2,54.29 37.47,53.02 SLOT202.B16 43.18,53.02 44.45,54.29 v73.98,54.29
A4#  (via drill 0.3)
  Top 0.305: IC201.6 71.44,44.13 72.39,45.09 72.39,59.69 73.03,60.33 v73.03,73.03 | v76.52,73.03 IC101.32
  Bottom 0.305: v73.03,73.03 v76.52,73.03
A5  (via drill 0.3)
  Top 0.305: v76.52,53.02 IC201.13
  Bottom 0.305: SLOT201.A16 36.2,53.02 37.47,51.75 43.18,51.75 44.45,53.02 SLOT202.A16 v76.52,53.02
A5#  (via drill 0.3)
  Top 0.305: IC201.7 73.98,44.13 74.93,45.09 74.93,59.69 75.56,60.33 v75.56,72.39 | v79.06,72.39 IC101.33
  Bottom 0.305: v75.56,72.39 v79.06,72.39
A6  (via drill 0.3)
  Top 0.305: v56.52,41.59 v56.52,47.31 | v79.06,47.31 IC201.12
  Bottom 0.305: SLOT201.B11 18.73,40.32 20,41.59 36.2,41.59 37.47,40.32 SLOT202.B11 43.18,40.32 44.45,41.59 v56.52,41.59 | v56.52,47.31 v79.06,47.31
A6#  (via drill 0.3)
  Top 0.305: IC201.8 76.52,44.13 77.47,45.09 77.47,59.69 78.11,60.33 v78.11,73.03 | v94.3,73.03 IC101.39
  Bottom 0.305: v78.11,73.03 v94.3,73.03
A7  (via drill 0.3)
  Top 0.305: v55.88,40.32 v55.88,47.94 | v81.6,47.94 IC201.11
  Bottom 0.305: SLOT201.A11 36.2,40.32 37.47,39.05 43.18,39.05 44.45,40.32 SLOT202.A11 v55.88,40.32 | v55.88,47.94 v81.6,47.94
A7#  (via drill 0.3)
  Top 0.305: IC201.9 79.06,44.13 80.01,45.09 80.01,59.69 80.64,60.33 v80.64,72.39 | v91.76,72.39 IC101.38
  Bottom 0.305: v80.64,72.39 v91.76,72.39
A8  (via drill 0.3)
  Top 0.305: v103.5,44.13 104.46,45.09 IC202.18
  Bottom 0.305: SLOT201.B12 18.41,42.86 19.68,44.13 36.2,44.13 37.47,42.86 SLOT202.B12 43.18,42.86 44.45,44.13 v103.5,44.13
A8#  (via drill 0.3)
  Top 0.305: IC202.2 101.92,44.13 102.87,45.09 102.87,59.69 103.5,60.33 v103.5,75.56 | v107,75.56 IC101.44
  Bottom 0.305: v103.5,75.56 v107,75.56
A9  (via drill 0.3)
  Top 0.305: v56.52,35.24 v56.52,37.47 | v106.05,38.42 106.05,44.13 107,45.09 IC202.17
  Bottom 0.305: SLOT201.A9 36.2,35.24 37.47,33.97 43.18,33.97 44.45,35.24 SLOT202.A9 v56.52,35.24 | v56.52,37.47 98.11,37.47 99.06,38.42 v106.05,38.42
A9#  (via drill 0.3)
  Top 0.305: IC202.3 104.46,44.13 105.41,45.09 105.41,59.69 106.05,60.33 v106.05,74.93 | v109.54,74.93 IC101.45
  Bottom 0.305: v106.05,74.93 v109.54,74.93
A10  (via drill 0.3)
  Top 0.305: v55.24,39.05 v55.24,44.77 | v109.54,44.77 IC202.16
  Bottom 0.305: SLOT201.B10 18.73,37.78 20,39.05 36.2,39.05 37.47,37.78 SLOT202.B10 43.18,37.78 44.45,39.05 v55.24,39.05 | v55.24,44.77 v109.54,44.77
A10#  (via drill 0.3)
  Top 0.305: IC202.4 107,44.13 107.95,45.09 107.95,59.69 108.58,60.33 v108.58,74.3 | v101.92,74.3 IC101.42
  Bottom 0.305: v108.58,74.3 v101.92,74.3
A11  (via drill 0.3)
  Top 0.305: v54.61,37.78 v54.61,46.04 | v112.08,46.04 IC202.15
  Bottom 0.305: SLOT201.A10 36.2,37.78 37.47,36.51 43.18,36.51 44.45,37.78 SLOT202.A10 v54.61,37.78 | v54.61,46.04 v112.08,46.04
A11#  (via drill 0.3)
  Top 0.305: IC202.5 109.54,43.81 110.49,44.77 110.49,59.69 111.12,60.33 v111.12,72.71 | v104.46,72.71 IC101.43
  Bottom 0.305: v111.12,72.71 v104.46,72.71
A12  (via drill 0.3)
  Top 0.305: v57.15,42.86 v57.15,48.58
  Bottom 0.305: SLOT201.A12 36.2,42.86 37.47,41.59 43.18,41.59 44.45,42.86 SLOT202.A12 v57.15,42.86 | v57.15,48.58 114.3,48.58 114.62,48.9 IC202.14
A12#  (via drill 0.3)
  Top 0.305: IC202.6 112.08,44.13 113.03,45.09 113.03,59.69 113.67,60.33 v113.67,80.64 | v71.44,80.64 IC101.30
  Bottom 0.305: v113.67,80.64 v71.44,80.64
A13  (via drill 0.3)
  Top 0.305: v117.16,46.67 IC202.13
  Bottom 0.305: SLOT201.B13 18.41,45.4 19.68,46.67 36.2,46.67 37.47,45.4 SLOT202.B13 43.18,45.4 44.45,46.67 v117.16,46.67
A13#  (via drill 0.3)
  Top 0.305: IC202.7 114.62,44.13 115.57,45.09 115.57,59.69 116.2,60.33 v116.2,81.28 | v73.98,81.28 IC101.31
  Bottom 0.305: v116.2,81.28 v73.98,81.28
A14  (via drill 0.3)
  Top 0.305: v119.7,45.4 IC202.12
  Bottom 0.305: SLOT201.A13 36.2,45.4 37.47,44.13 43.18,44.13 44.45,45.4 SLOT202.A13 v119.7,45.4
A14#  (via drill 0.3)
  Top 0.305: IC202.8 117.16,44.13 118.11,45.09 118.11,59.69 118.75,60.33 v118.75,93.98 | v73.98,93.98 IC101.18
  Bottom 0.305: v118.75,93.98 v73.98,93.98
A15  (via drill 0.3)
  Top 0.305: v57.15,36.51 v57.15,38.1 | v120.97,39.69 120.97,44.13 122.24,45.4 IC202.11
  Bottom 0.305: SLOT201.B9 18.73,35.24 20,36.51 36.2,36.51 37.47,35.24 SLOT202.B9 43.18,35.24 44.45,36.51 v57.15,36.51 | v57.15,38.1 97.47,38.1 99.06,39.69 v120.97,39.69
A15#  (via drill 0.3)
  Top 0.305: IC202.9 119.7,44.13 120.65,45.09 120.65,59.69 121.28,60.33 v121.28,94.61 | v71.44,94.61 IC101.19
  Bottom 0.305: v121.28,94.61 v71.44,94.61
CLK  (via drill 0.3)
  Top 0.305: v52.7,66.99 v52.7,13.34 | v81.6,13.34 IC206.11
  Bottom 0.305: SLOT201.B21 18.73,65.72 20,66.99 36.2,66.99 37.47,65.72 SLOT202.B21 43.18,65.72 44.45,66.99 v52.7,66.99 | v52.7,13.34 v81.6,13.34
CLK#  (via drill 0.3)
  Top 0.305: v59.69,96.52 59.69,79.69 58.74,78.74 IC101.25 v58.74,71.12 | IC101.5 v107,95.25 | v86.36,71.12 86.36,60.01 87.31,59.05 v87.31,10.79 | v79.06,10.79 IC206.9
  Bottom 0.305: v59.69,96.52 R201.2 65.72,95.57 66.04,95.25 v107,95.25 | v58.74,71.12 v86.36,71.12 | v87.31,10.79 v79.06,10.79
D0  (via drill 0.3)
  Top 0.305: v55.88,56.83 v55.88,61.28 | v63.82,61.28 IC203.18 | IC204.18 v104.46,61.28
  Bottom 0.305: SLOT201.B17 18.41,55.56 19.68,56.83 36.2,56.83 37.47,55.56 SLOT202.B17 43.18,55.56 44.45,56.83 v55.88,56.83 | v55.88,61.28 v63.82,61.28 v104.46,61.28
D0#  (via drill 0.3)
  Top 0.305: IC203.2 61.28,59.69 62.23,60.64 v62.23,89.53 | v89.22,89.53 IC101.12 | IC204.2 101.92,59.69 102.87,60.64 v102.87,89.53
  Bottom 0.305: v62.23,89.53 v89.22,89.53 v102.87,89.53
D1  (via drill 0.3)
  Top 0.305: v55.24,55.56 v55.24,67.63 | v66.36,67.63 IC203.17 | IC204.17 v107,67.63
  Bottom 0.305: SLOT201.A17 36.2,55.56 37.47,54.29 43.18,54.29 44.45,55.56 SLOT202.A17 v55.24,55.56 | v55.24,67.63 v66.36,67.63 v107,67.63
D1#  (via drill 0.3)
  Top 0.305: IC203.3 63.82,59.69 64.77,60.64 v64.77,90.81 | v84.14,90.81 IC101.14 | IC204.3 104.46,59.69 105.41,60.64 v105.41,90.81
  Bottom 0.305: v64.77,90.81 v84.14,90.81 v105.41,90.81
D2  (via drill 0.3)
  Top 0.305: v57.15,59.37 v57.15,63.82 | v68.9,63.82 IC203.16 | IC204.16 v109.54,63.82
  Bottom 0.305: SLOT201.B18 18.41,58.1 19.68,59.37 36.2,59.37 37.47,58.1 SLOT202.B18 43.18,58.1 44.45,59.37 v57.15,59.37 | v57.15,63.82 v68.9,63.82 v109.54,63.82
D2#  (via drill 0.3)
  Top 0.305: IC203.4 66.36,59.69 67.31,60.64 v67.31,90.17 | v86.68,90.17 IC101.13 | IC204.4 107,59.69 107.95,60.64 v107.95,90.17
  Bottom 0.305: v67.31,90.17 v86.68,90.17 v107.95,90.17
D3  (via drill 0.3)
  Top 0.305: v56.52,58.1 v56.52,62.55 | v71.44,62.55 IC203.15 | IC204.15 v112.08,62.55
  Bottom 0.305: SLOT201.A18 36.2,58.1 37.47,56.83 43.18,56.83 44.45,58.1 SLOT202.A18 v56.52,58.1 | v56.52,62.55 v71.44,62.55 v112.08,62.55
D3#  (via drill 0.3)
  Top 0.305: IC203.5 68.9,59.69 69.85,60.64 v69.85,78.74 | v84.14,78.74 IC101.35 | IC204.5 109.54,59.69 110.49,60.64 v110.49,78.74
  Bottom 0.305: v69.85,78.74 v84.14,78.74 v110.49,78.74
D4  (via drill 0.3)
  Top 0.305: v73.98,61.91 IC203.14 | IC204.14 v114.62,61.91
  Bottom 0.305: SLOT201.B19 18.41,60.64 19.68,61.91 36.2,61.91 37.47,60.64 SLOT202.B19 43.18,60.64 44.45,61.91 v73.98,61.91 v114.62,61.91
D4#  (via drill 0.3)
  Top 0.305: IC203.6 71.44,59.69 72.39,60.64 v72.39,88.9 | v94.3,88.9 IC101.10 | IC204.6 112.08,59.69 113.03,60.64 v113.03,88.9
  Bottom 0.305: v72.39,88.9 v94.3,88.9 v113.03,88.9
D5  (via drill 0.3)
  Top 0.305: v76.52,60.64 IC203.13 | IC204.13 v117.16,60.64
  Bottom 0.305: SLOT201.A19 36.2,60.64 37.47,59.37 43.18,59.37 44.45,60.64 SLOT202.A19 v76.52,60.64 v117.16,60.64
D5#  (via drill 0.3)
  Top 0.305: IC203.7 73.98,59.69 74.93,60.64 v74.93,88.27 | v96.84,88.27 IC101.9 | IC204.7 114.62,59.69 115.57,60.64 v115.57,88.27
  Bottom 0.305: v74.93,88.27 v96.84,88.27 v115.57,88.27
D6  (via drill 0.3)
  Top 0.305: v79.06,64.45 IC203.12 | IC204.12 v119.7,64.45
  Bottom 0.305: SLOT201.B20 18.41,63.18 19.68,64.45 36.2,64.45 37.47,63.18 SLOT202.B20 43.18,63.18 44.45,64.45 v79.06,64.45 v119.7,64.45
D6#  (via drill 0.3)
  Top 0.305: IC203.8 76.52,59.69 77.47,60.64 v77.47,79.38 | v66.36,79.38 IC101.28 | IC204.8 117.16,59.69 118.11,60.64 v118.11,79.38
  Bottom 0.305: v66.36,79.38 v77.47,79.38 v118.11,79.38
D7  (via drill 0.3)
  Top 0.305: v81.6,63.18 IC203.11 | IC204.11 v122.24,63.18
  Bottom 0.305: SLOT201.A20 36.2,63.18 37.47,61.91 43.18,61.91 44.45,63.18 SLOT202.A20 v81.6,63.18 v122.24,63.18
D7#  (via drill 0.3)
  Top 0.305: IC203.9 79.06,59.69 80.01,60.64 v80.01,80.01 | v68.9,80.01 IC101.29 | IC204.9 119.7,59.69 120.65,60.64 v120.65,80.01
  Bottom 0.305: v68.9,80.01 v80.01,80.01 v120.65,80.01
GND  (via drill 0.3)
  Top 0.61: IC206.19 v61.28,12.06 | IC201.19 v61.28,56.2 | IC101.34 v81.6,69.53
  pour Bottom: 0,99.69 139.7,99.69 139.7,0 0,0
N$1  (via drill 0.3)
  Top 0.305: LED101.A 123.19,93.98 128.91,88.9 v128.91,77.15
  Top 0.61: C111.+ 130.49,33.34 128.91,34.92 v128.91,77.15
  Bottom 0.61: C110.2 133.35,23.5 134.94,25.08 D101.C 133.35,27.3 131.89,28.77 C111.+ | v128.91,77.15 IC101.48
N$2
  Bottom 0.61: X101.1 119.01,14.87 R101.2
TEST  (via drill 0.3)
  Top 0.305: IC206.15 v71.44,10.16 | v83.19,10.16 v83.19,2.54
  Bottom 0.305: v71.44,10.16 v83.19,10.16 | v83.19,2.54 JP201.1 JP201.3
TEST#  (via drill 0.3)
  Top 0.305: RN202.6 IC206.5 v68.9,12.06 | IC101.21 v66.36,86.36 | v87.63,86.36 87.63,60.64 88.58,59.69 v88.58,12.06
  Bottom 0.305: v66.36,86.36 v87.63,86.36 | v88.58,12.06 v68.9,12.06
V+
  Bottom 0.61: SW101.2 126.36,13.34 127.95,14.92 R101.1

### Text on the board
tNames: SLOT 1 | SLOT 2 | MSX | EXP | msx_usb2slot.brd | (c) 2019-2026 by Dr.-Ing. Th. Wiesner | 29.09.2026